# Altium schematic sheet MENU_BUTTONS.SchDoc
size A4; SheetNumber: 11; SheetTotal: 12
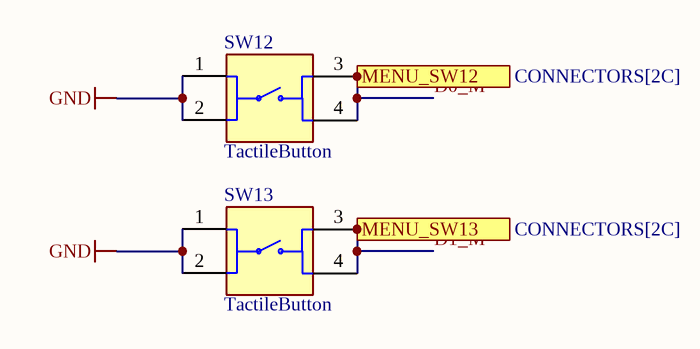
[diagram p0: MENU_BUTTONS.SchDoc]

## Parts
SW12  TactileButton  [KS01_B_12MM]
SW13  TactileButton  [KS01_B_12MM]

## Ports
MENU_SW12 (see CONNECTORS[2C]), MENU_SW13 (see CONNECTORS[2C])

## Nets
GND: SW12.1 SW12.2 SW13.1 SW13.2
D0_M: SW12.3 SW12.4 ; port MENU_SW12
D1_M: SW13.3 SW13.4 ; port MENU_SW13

## Library data of the parts
SW12 SW13 = TactileButton: FSM4JH=6MM TACT SWITCH, HIGH TEMP; MF: TE Connectivity; MP: 1825910-6; SnapEDA_Link: https://www.snapeda.com/parts/1825910-6/TE+Connectivity+Alcoswitch+Switches/view-part/?ref=snap; Package: None; Value: *; Check_prices: https://www.snapeda.com/parts/1825910-6/TE+Connectivity+Alcoswitch+Switches/view-part/?ref=eda